# Altium schematic sheet MainController3.SchDoc
size A4; SheetNumber: 4; SheetTotal: 5
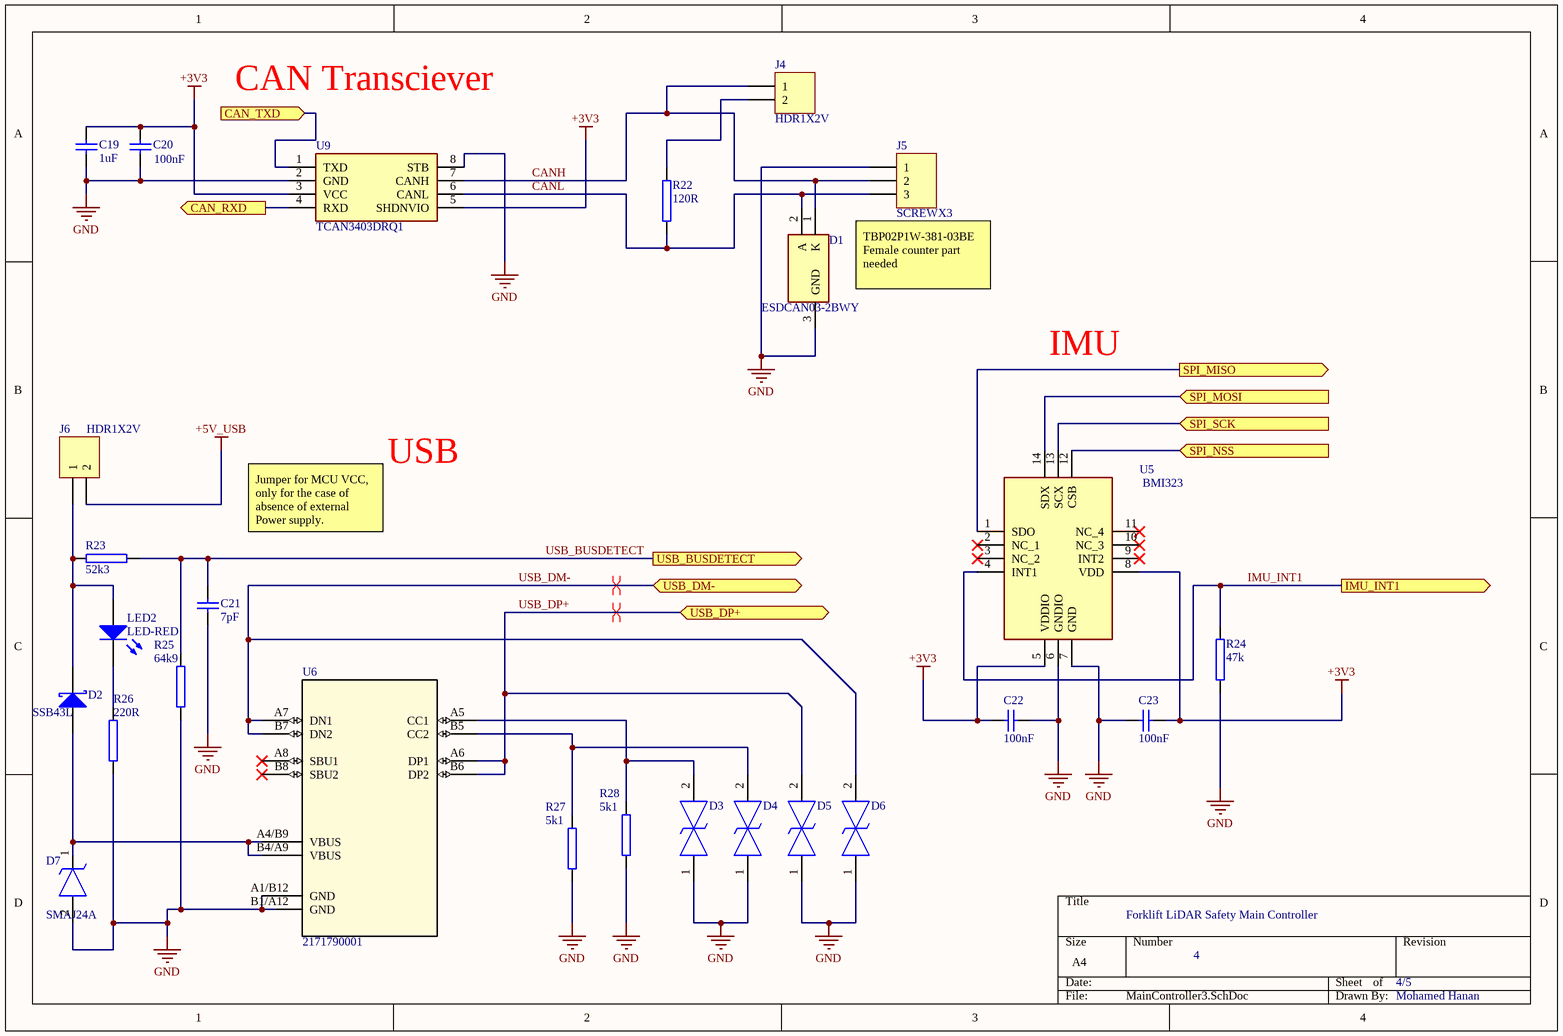
[diagram p0: MainController3.SchDoc]

## Parts
C19  1uF  [CAP_0805]
C20  100nF  [CAP_0805]
C21  7pF  [CAP_0805]
C22  100nF  [CAP_0805]
C23  100nF  [CAP_0805]
D1  ESDCAN03-2BWY  [SOT65P210X110-3N]
D2  SSB43L  [DO-214AA(SMB)]
D3  TSD05CDYFR  [SOD2613X100N]  (value not drawn)
D4  TSD05CDYFR  [SOD2613X100N]  (value not drawn)
D5  TSD05CDYFR  [SOD2613X100N]  (value not drawn)
D6  TSD05CDYFR  [SOD2613X100N]  (value not drawn)
D7  SMAJ24A  [DIOM5127X229N]
J4  HDR1X2V  [HDR1X2_AUT]
J5  SCREWX3  [SCREW3_AUT]
J6  HDR1X2V  [HDR1X2_AUT]
LED2  LED-RED  [LED1206R]
R22  120R  [RES_1206]
R23  52k3  [RES_0805]
R24  47k  [RES_0805]
R25  64k9  [RES_0805]
R26  220R  [RES_0805]
R27  5k1  [RES_0805]
R28  5k1  [RES_0805]
U5  BMI323  [BMI323]
U6  2171790001  [2171790001_MOL]
U9  TCAN3403DRQ1  [SOIC127P600X175-8N - duplicate]

## Ports
CAN_RXD (out, see ConnectionMain[2C], MainController[3A]), CAN_TXD (in, see ConnectionMain[2C], MainController[3A]), IMU_INT1 (out, see ConnectionMain[2C], MainController[3C]), SPI_MISO (out, see ConnectionMain[2C], MainController[3C]), SPI_MOSI (in, see ConnectionMain[2C], MainController[3C]), SPI_NSS (in, see ConnectionMain[2C], MainController[3C]), SPI_SCK (in, see ConnectionMain[2C], MainController[3C]), USB_BUSDETECT (out, see ConnectionMain[2D], MainController[1C]), USB_DM- (bidir, see ConnectionMain[2D], MainController[3B]), USB_DP+ (bidir, see ConnectionMain[2D], MainController[3B])

## Nets
+3V3: C19.2 C20.2 C22.1 C23.2 U5.5(VDDIO) U5.8(VDD) U9.3(VCC) U9.5(SHDNVIO)
+5V_USB: J6.2
GND: C19.1 C20.1 C21.1 C22.2 C23.1 D1.3(GND) D3.1 D4.1 D5.1 D6.1 D7.2(A) J5.1 R24.1 R25.1 R26.1 R27.1 R28.1 U5.6(GNDIO) U5.7(GND) U6.A1/B12(GND) U6.B1/A12(GND) U9.2(GND) U9.8(STB)
CAN_RXD: U9.4(RXD) ; port CAN_RXD
CAN_TXD: U9.1(TXD) ; port CAN_TXD
CANH: D1.1(K) J4.1 J5.2 U9.7(CANH)
CANL: D1.2(A) J5.3 R22.1 U9.6(CANL)
IMU_INT1: R24.2 U5.4(INT1) ; port IMU_INT1
SPI_MISO: U5.1(SDO) ; port SPI_MISO
SPI_MOSI: U5.14(SDX) ; port SPI_MOSI
SPI_NSS: U5.12(CSB) ; port SPI_NSS
SPI_SCK: U5.13(SCX) ; port SPI_SCK
USB_BUSDETECT: C21.2 R23.2 R25.2 ; port USB_BUSDETECT
USB_DM-: D6.2 U6.A7(DN1) U6.B7(DN2) ; port USB_DM-
USB_DP+: D5.2 U6.A6(DP1) U6.B6(DP2) ; port USB_DP+
NetD2_A: D2.A D7.1(K) U6.A4/B9(VBUS) U6.B4/A9(VBUS)
NetD2_K: D2.K J6.1 LED2.A R23.1
NetD3_2: D3.2 R28.2 U6.A5(CC1)
NetD4_2: D4.2 R27.2 U6.B5(CC2)
NetJ4_2: J4.2 R22.2
NetLED2_K: LED2.K R26.2

Not connected (* = marked no-connect by the designer): U5 2(NC_1)* 3(NC_2)* 9(INT2)* 10(NC_3)* 11(NC_4)*; U6 A8(SBU1)* B8(SBU2)*

## Layout directives
differential pair; differential pair class DIFF_USB: USB_DM-, USB_DP+

## Notes on the sheet
- CAN Transciever
- TBP02P1W-381-03BE
  Female counter part needed
- IMU
- USB
- Jumper for MCU VCC, only for the case of absence of external Power supply.
- Forklift LiDAR Safety Main Controller
- 4
- 4/5
- Mohamed Hanan

## Library data of the parts
C19-C23 = CAPN 0805: Non Polarized Capacitor, SMD, 0805
D1 = ESDCAN03-2BWY: TVS Diode (Uni-directional); Manufacturer_Name: STMicroelectronics; Datasheet Link: https://www.st.com/resource/en/datasheet/esdcan03-2bwy.pdf; Height: 1.1mm; Manufacturer_Part_Number: ESDCAN03-2BWY; Mouser Part Number: 511-ESDCAN03-2BWY; Mouser Price/Stock: https://www.mouser.co.uk/ProductDetail/STMicroelectronics/ESDCAN03-2BWY?qs=FqY30PPN9V2iiokjuqa22Q%3D%3D; Arrow Part Number: ESDCAN03-2BWY; Arrow Price/Stock: https://www.arrow.com/en/products/esdcan03-2bwy/stmicroelectronics.html?utm_currency=USD&region=europe
D2 = SSB43L: Schottky Diode, 4A, 30v; Supplier 1: Farnell; Supplier Part Number 1: 1336556
D3-D6 = TSD05CDYFR: TVS Diode (Bi-directional); Manufacturer_Name: Texas Instruments; Datasheet Link: https://www.ti.com/lit/ds/symlink/tsd05c.pdf?ts=1691730725852&ref_url=https%253A%252F%252Fwww.ti.com%252Fproduct%252FTSD05C%253FkeyMatch%253DTSD05CDYFR%2526tisearch%253Dsearch-everything%2526usecase%253DOPN; Height: 1mm; Manufacturer_Part_Number: TSD05CDYFR; Mouser Part Number: 595-TSD05CDYFR; Mouser Price/Stock: https://www.mouser.co.uk/ProductDetail/Texas-Instruments/TSD05CDYFR?qs=Imq1NPwxi74wAiGFX0POZQ%3D%3D; Arrow Part Number: TSD05CDYFR; Arrow Price/Stock: https://www.arrow.com/en/products/tsd05cdyfr/texas-instruments.html?utm_currency=USD&region=nac
D7 = SMAJ24A: TVS Diode (Uni-directional); Manufacturer_Name: Vishay; Datasheet Link: https://www.vishay.com/docs/88390/smaj50a.pdf; Height: 2.29mm; Manufacturer_Part_Number: SMAJ24A; Mouser Part Number: 78-SMAJ24A; Mouser Price/Stock: https://www.mouser.co.uk/ProductDetail/Vishay-General-Semiconductor/SMAJ24A?qs=N78E2i60HJ5M5XdBeXM0ag%3D%3D
J4 J6 = HDR1X2V: Header, Plug, 2.54mm, 2 Pins, Straight; Supplier 1: Farnell; Supplier Part Number 1: 2254030
J5 = SCREWX3: Terminal Block, PCB, 3Way, Pitch 5mm; Supplier 1: Farnell; Supplier Part Number 1: 9632689
LED2 = SMD 1206 LED-RED: RED LED, Case 1206; Supplier 1: Farnell; Supplier Part Number 1: 8530017
R22 = Resistor 1206: Resistor, SMD, 1206
R23-R28 = Resistor 0805: Resistor, SMD, 0805
U5 = BMI323: Integrated Circuit; Manufacturer_Name: BOSCH; Datasheet Link: https://www.bosch-sensortec.com/media/boschsensortec/downloads/datasheets/bst-bmi323-ds000.pdf; Height: 0.87mm; Manufacturer_Part_Number: BMI323; Mouser Part Number: 262-BMI323; Mouser Price/Stock: https://www.mouser.co.uk/ProductDetail/Bosch-Sensortec/BMI323?qs=By6Nw2ByBD3%2FE1v0UqNQPQ%3D%3D; Arrow Part Number: BMI323; Arrow Price/Stock: https://www.arrow.com/en/products/bmi323/bosch-sensortec?utm_currency=USD&region=nac
U6 = 2171790001: Universal Serial Bus (USB) Shielded I/O Receptacle, Type C, Right-Angle, Top Mount, Surface Mount, Single Row, 16 Circuits, Gold (Au) Plating; Manufacturer_Name: Molex Connector Corporation; Copyright: Copyright (C) 2025 Ultra Librarian. All rights reserved.; Manufacturer_Part_Number: 2171790001; RefDes: RefDes; Type: Type
U9 = TCAN3403DRQ1: Integrated Circuit; Manufacturer_Name: Texas Instruments; Datasheet Link: https://www.ti.com/lit/ds/symlink/tcan3403-q1.pdf?ts=1732780388772&ref_url=https%253A%252F%252Fwww.ti.com%252Fproduct%252FTCAN3403-Q1%252Fpart-details%252FTCAN3403DRQ1; Height: 1.75mm; Manufacturer_Part_Number: TCAN3403DRQ1; Mouser Part Number: 595-TCAN3403DRQ1; Mouser Price/Stock: https://www.mouser.co.uk/ProductDetail/Texas-Instruments/TCAN3403DRQ1?qs=VVKQmw408U8i3BeOClYB9g%3D%3D; Arrow Part Number: TCAN3403DRQ1; Arrow Price/Stock: https://www.arrow.com/en/products/tcan3403drq1/texas-instruments?utm_currency=USD&region=nac